# Altium project MainBoard_02_2023.PrjPcb
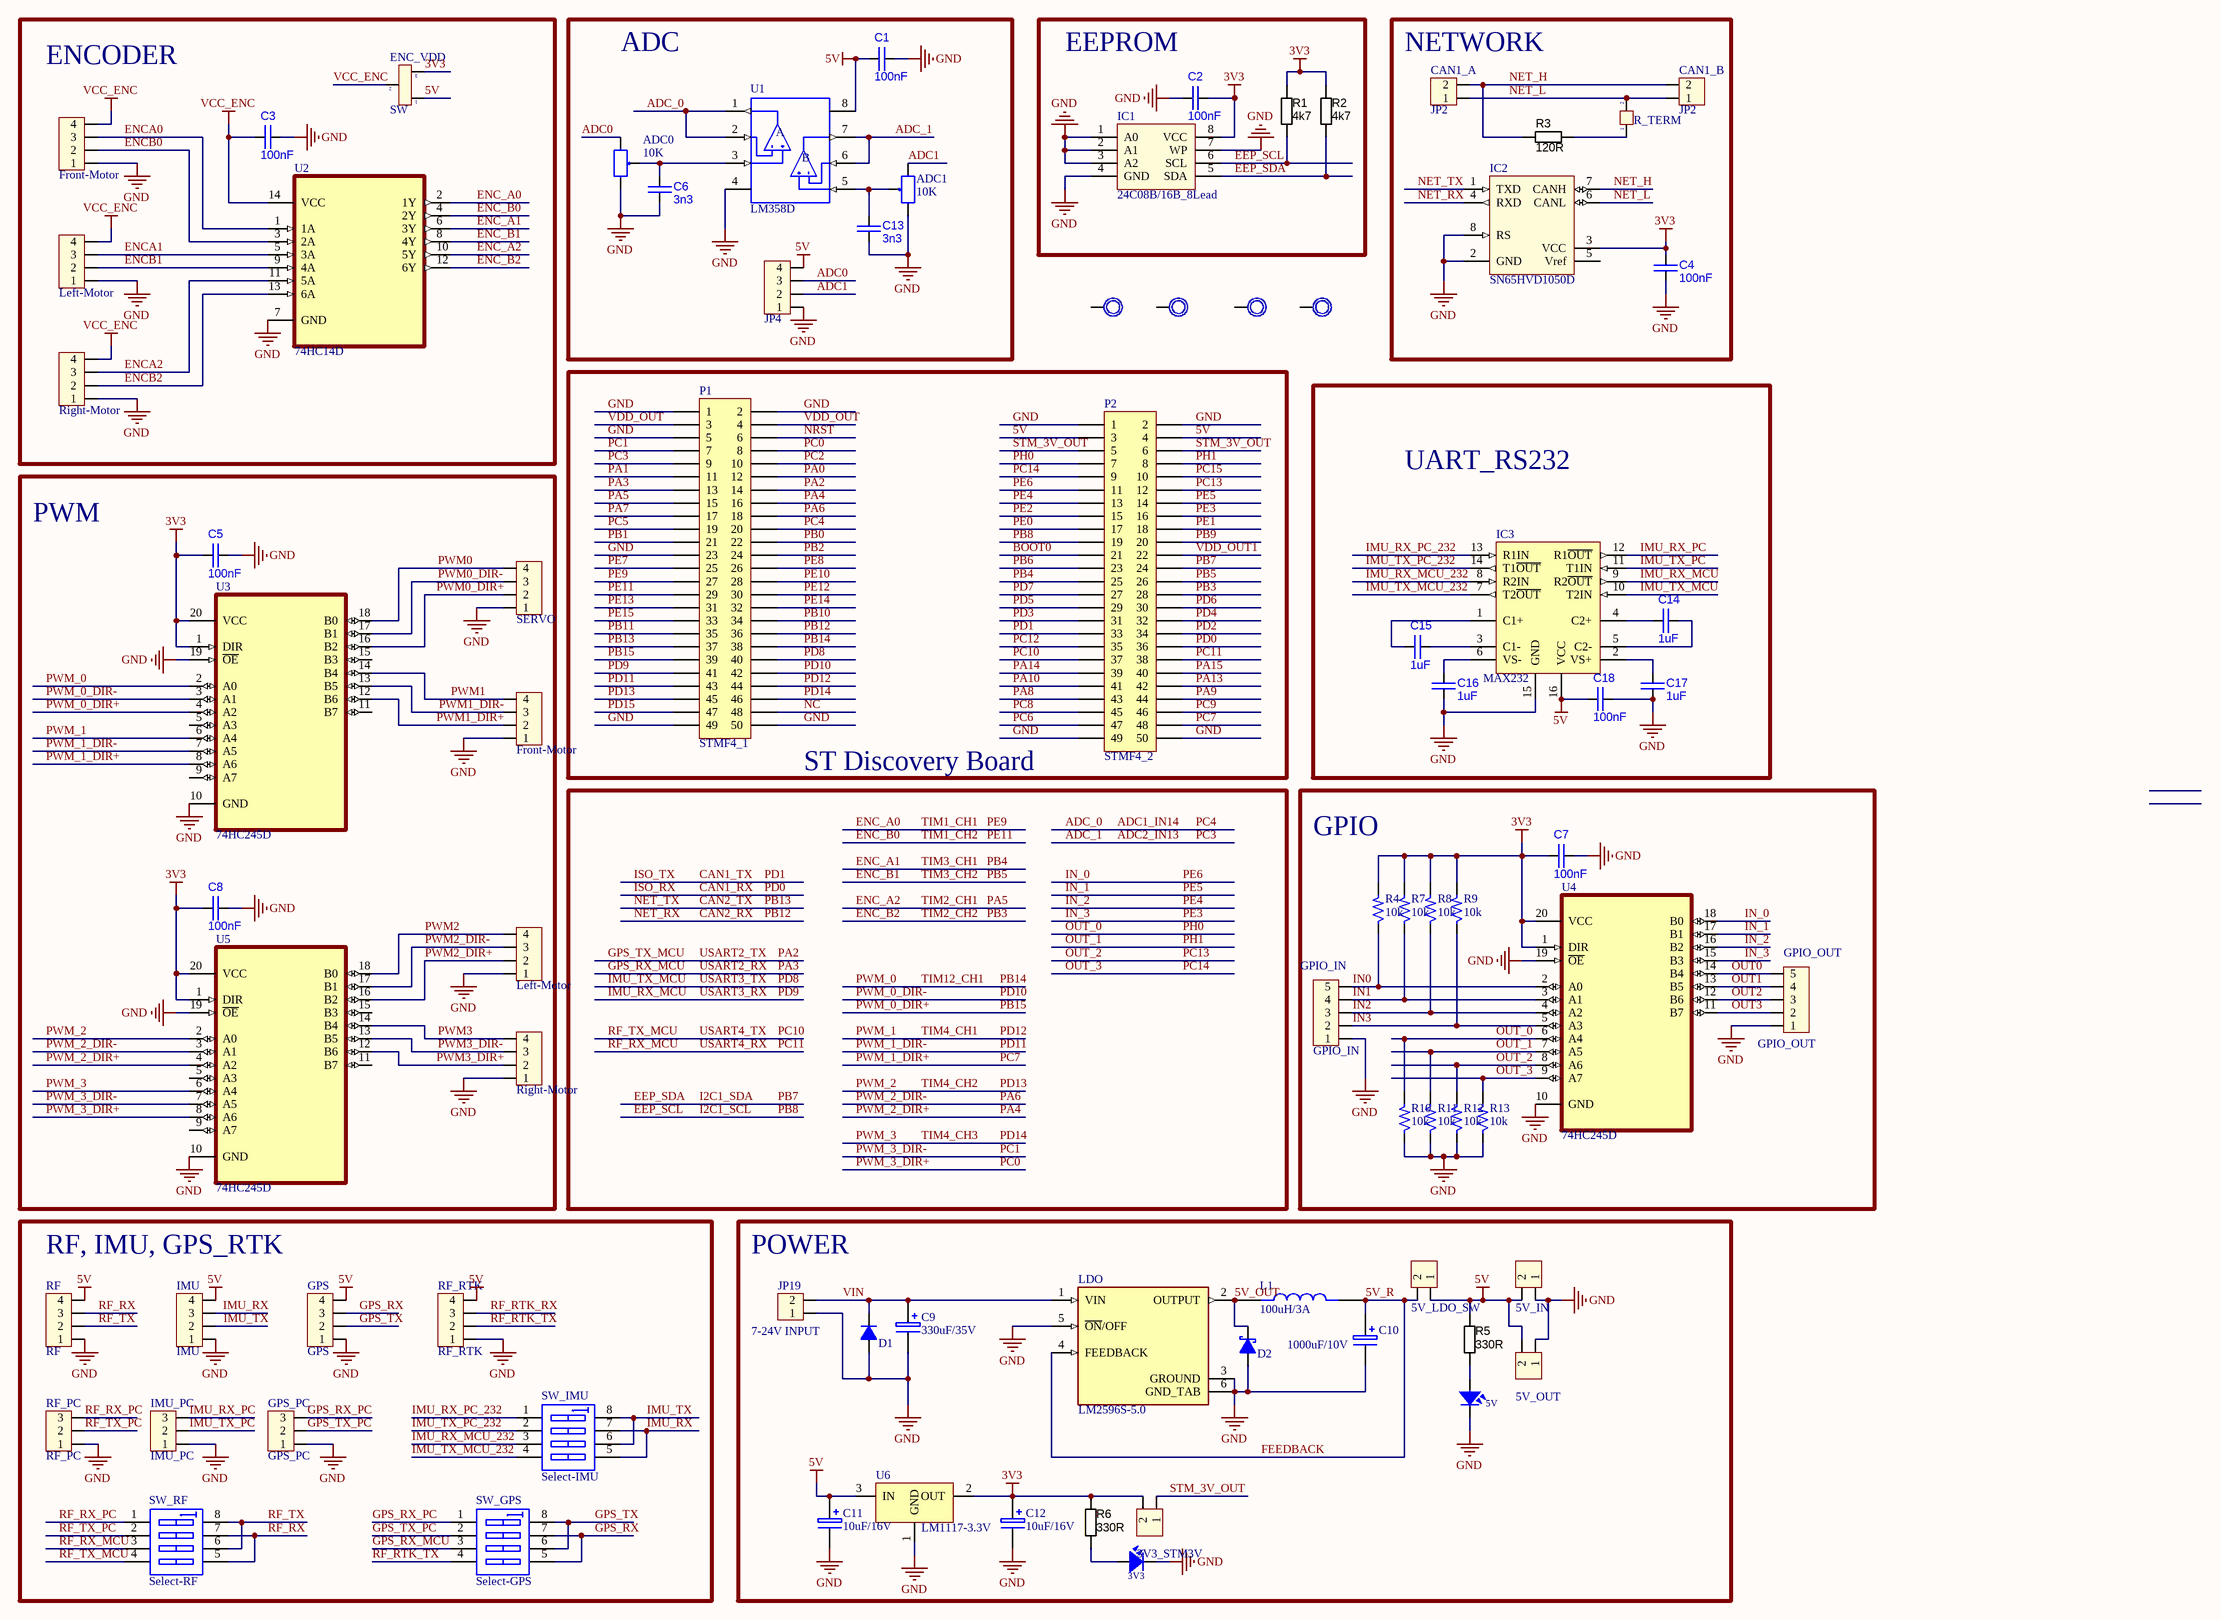
[diagram p0: Sheet1.SchDoc]
1 sheet, 83 parts. Net scope: global (net labels, ports and power ports of the same name join across sheets).
Board file: PCB2.PcbDoc

## Sheet Sheet1.SchDoc
size C

### Parts
3V3  LED SMD  [SM-LED-0805-Red]  (value not drawn)
3V3_STM3V  connector  [JP2]  (value not drawn)
5V  LED SMD  [SM-LED-0805-Red]  (value not drawn)
5V_IN  connector  [CON2]  (value not drawn)
5V_LDO_SW  connector  [JP2]  (value not drawn)
5V_OUT  connector  [CON2]  (value not drawn)
ADC  JP4  [CON4]
ADC0  10K  [VR1]
ADC1  10K  [VR1]
C1  value 100nF  [CAPC2012X135N]  (hidden comment: approved sub OK)
C2  value 100nF  [CAPC2012X135N]  (hidden comment: approved sub OK)
C3  value 100nF  [CAPC2012X135N]  (hidden comment: approved sub OK)
C4  value 100nF  [CAPC2012X135N]  (hidden comment: approved sub OK)
C5  value 100nF  [CAPC2012X135N]  (hidden comment: approved sub OK)
C6  value 3n3  [CAPC2012X135N]  (hidden comment: approved sub OK)
C7  value 100nF  [CAPC2012X135N]  (hidden comment: approved sub OK)
C8  value 100nF  [CAPC2012X135N]  (hidden comment: approved sub OK)
C9  330uF/35V  [cap_A_SMD 470uF/16V]
C10  1000uF/10V  [cap_A_SMD 470uF/16V]
C11  10uF/16V  [cap_A_SMD 10uF/16V]
C12  10uF/16V  [cap_A_SMD 10uF/16V]
C13  value 3n3  [CAPC2012X135N]  (hidden comment: approved sub OK)
C14  value 1uF  [CAPC2012X135N]  (hidden comment: approved sub OK)
C15  value 1uF  [CAPC2012X135N]  (hidden comment: approved sub OK)
C16  value 1uF  [CAPC2012X135N]  (hidden comment: approved sub OK)
C17  value 1uF  [CAPC2012X135N]  (hidden comment: approved sub OK)
C18  value 100nF  [CAPC2012X135N]  (hidden comment: approved sub OK)
CAN1_A  JP2  [CON2]
CAN1_B  JP2  [CON2]
D1  Diode  1N4007  [DO-214AC]  (value not drawn)
D2  Diode  Schottky 1N5819  [DO-214AC]  (value not drawn)
ENC_0  Front-Motor  [CON4]
ENC_1  Left-Motor  [CON4]
ENC_2  Right-Motor  [CON4]
ENC_VDD  SW  [JP3]
GPIO_IN  GPIO_IN  [CON5]
GPIO_OUT  GPIO_OUT  [CON5]
GPS  GPS  [CON4]
GPS_PC  GPS_PC  [CON3]
IC1  24C08B/16B_8Lead  [SOIC127P800X175-8N]
IC2  SN65HVD1050D  [SO-8N]
IC3  MAX232  [SO-G16]
IMU  IMU  [CON4]
IMU_PC  IMU_PC  [CON3]
JP19  7-24V INPUT  [MSTB 2/5.08mm]
L1  100uH/3A  [IND_B82477P4104M000]
LDO  LM2596S-5.0  [TO170P1524X483-6N]
P1  STMF4_1  [HDR2X25]
P2  STMF4_2  [HDR2X25]
PWM_1  Front-Motor  [CON4]
PWM_2  Left-Motor  [CON4]
PWM_3  Right-Motor  [CON4]
R1  value 4k7  [RESC2012N_ZERO]  (hidden comment: Jumper)
R2  value 4k7  [RESC2012N_ZERO]  (hidden comment: Jumper)
R3  value 120R  [RESC2012N_ZERO]  (hidden comment: Jumper)
R4  10k  [RESC2012N_ZERO]
R5  value 330R  [RESC2012N_ZERO]  (hidden comment: Jumper)
R6  value 330R  [RESC2012N_ZERO]  (hidden comment: Jumper)
R7  10k  [RESC2012N_ZERO]
R8  10k  [RESC2012N_ZERO]
R9  10k  [RESC2012N_ZERO]
R10  10k  [RESC2012N_ZERO]
R11  10k  [RESC2012N_ZERO]
R12  10k  [RESC2012N_ZERO]
R13  10k  [RESC2012N_ZERO]
R_TERM  Jumper 2  [JP2]  (value not drawn)
RF  RF  [CON4]
RF_PC  RF_PC  [CON3]
RF_RTK  RF_RTK  [CON4]
SERVO  SERVO  [CON4]
SW_GPS  Select-GPS  [DIP8/W0.3K]
SW_IMU  Select-IMU  [DIP8/W0.3K]
SW_RF  Select-RF  [DIP8/W0.3K]
TP1  TP  [TP6]  (value not drawn)
TP2  TP  [TP6]  (value not drawn)
TP3  TP  [TP6]  (value not drawn)
TP4  TP  [TP6]  (value not drawn)
U1  LM358D  [SOIC127P599X175-8N]
U2  74HC14D  [SOIC127P600X175-14N]
U3  74HC245D  [SOIC127P1032X265-20N]
U4  74HC245D  [SOIC127P1032X265-20N]
U5  74HC245D  [SOIC127P1032X265-20N]
U6  LM1117-3.3V  [LM1117-SOP]

### Blocks framed on the sheet
ENCODER: C3 ENC_0-ENC_2 ENC_VDD U2
ADC: ADC ADC0 ADC1 C1 C6 C13 U1
EEPROM: C2 IC1 R1 R2
NETWORK: C4 CAN1_A CAN1_B IC2 R3 R_TERM
ST Discovery Board: P1 P2
UART_RS232: C14-C18 IC3
PWM: C5 C8 PWM_1-PWM_3 SERVO U3 U5
GPIO: C7 GPIO_IN GPIO_OUT R4 R7-R13 U4
RF, IMU, GPS_RTK: GPS GPS_PC IMU IMU_PC RF RF_PC RF_RTK SW_GPS SW_IMU SW_RF
POWER: 3V3 3V3_STM3V 5V 5V_IN 5V_LDO_SW 5V_OUT C9-C12 D1 D2 JP19 L1 LDO R5 R6 U6

### Nets
3V3: 3V3_STM3V.2 C2.2 C4.2 C5.2 C7.2 C8.2 C12.1 ENC_VDD.3 IC1.8(VCC) IC2.3(VCC) R1.1 R2.1 R4.2 R6.1 R7.2 R8.2 R9.2 U3.1(DIR) U3.20(VCC) U4.1(DIR) U4.20(VCC) U5.1(DIR) U5.20(VCC) U6.2(OUT)
5V: 5V_IN.2 5V_LDO_SW.1 5V_OUT.2 ADC.4 C1.2 C11.1 C18.2 ENC_VDD.1 GPS.4 IC3.16(VCC) IMU.4 P2.3 P2.4 R5.1 RF.4 RF_RTK.4 U1.8(V+) U6.3(IN)
GND: 3V3.2 5V.2 5V_IN.1 5V_OUT.1 ADC.1 ADC0.1 ADC1.3 C1.1 C2.1 C3.1 C4.1 C5.1 C6.2 C7.1 C8.1 C9.2 C10.2 C11.2 C12.2 C13.2 C16.1 C17.1 C18.1 D1.A D2.A ENC_0.1 ENC_1.1 ENC_2.1 GPIO_IN.1 GPIO_OUT.1 GPS.1 GPS_PC.1 IC1.1(A0) IC1.2(A1) IC1.3(A2) IC1.4(GND) IC1.7(WP) IC2.2(GND) IC2.8(RS) IC3.15(GND) IMU.1 IMU_PC.1 JP19.1 LDO.3(GROUND) LDO.5(~{ON}/OFF) LDO.6(GND_TAB) P1.1 P1.2 P1.5 P1.23 P1.49 P1.50 P2.1 P2.2 P2.49 P2.50 PWM_1.1 PWM_2.1 PWM_3.1 R10.1 R11.1 R12.1 R13.1 RF.1 RF_PC.1 RF_RTK.1 SERVO.1 U1.4(V-) U2.7(GND) U3.10(GND) U3.19(~{OE}) U4.10(GND) U4.19(~{OE}) U5.10(GND) U5.19(~{OE}) U6.1(GND)
VCC_ENC: C3.2 ENC_0.4 ENC_1.4 ENC_2.4 ENC_VDD.2 U2.14(VCC)
5V_OUT: D2.K L1.1 LDO.2(OUTPUT)
5V_R: 5V_LDO_SW.2 C10.1 L1.2 LDO.4(FEEDBACK)  [also labelled FEEDBACK]
ADC0: ADC.3 ADC0.3
ADC1: ADC.2 ADC1.1
ADC1_IN14: P1.20 U1.1(OUT1) U1.2(IN1-)  [also labelled ADC_0, PC4]
ADC2_IN13: P1.9 U1.6(IN2-) U1.7(OUT2)  [also labelled ADC_1, PC3]
BOOT0: P2.21
CAN1_RX: P2.36  [also labelled ISO_RX, PD0]
CAN1_TX: P2.33  [also labelled ISO_TX, PD1]
CAN2_RX: IC2.4(RXD) P1.36  [also labelled NET_RX, PB12]
CAN2_TX: IC2.1(TXD) P1.37  [also labelled NET_TX, PB13]
EEP_SCL: IC1.6(SCL) P2.19 R1.2  [also labelled I2C1_SCL, PB8]
EEP_SDA: IC1.5(SDA) P2.24 R2.2  [also labelled I2C1_SDA, PB7]
ENC_A0: P1.27 U2.2(1Y)  [also labelled PE9, TIM1_CH1]
ENC_A1: P2.25 U2.6(3Y)  [also labelled PB4, TIM3_CH1]
ENC_A2: P1.15 U2.10(5Y)  [also labelled PA5, TIM2_CH1]
ENC_B0: P1.29 U2.4(2Y)  [also labelled PE11, TIM1_CH2]
ENC_B1: P2.26 U2.8(4Y)  [also labelled PB5, TIM3_CH2]
ENC_B2: P2.28 U2.12(6Y)  [also labelled PB3, TIM2_CH2]
ENCA0: ENC_0.3 U2.1(1A)
ENCA1: ENC_1.3 U2.5(3A)
ENCA2: ENC_2.3 U2.11(5A)
ENCB0: ENC_0.2 U2.3(2A)
ENCB1: ENC_1.2 U2.9(4A)
ENCB2: ENC_2.2 U2.13(6A)
GPS_RX: GPS.3 SW_GPS.5(B4) SW_GPS.7(B2)
GPS_RX_MCU: P1.13 SW_GPS.3(A3)  [also labelled PA3, USART2_RX]
GPS_RX_PC: GPS_PC.3 SW_GPS.1(A1)
GPS_TX: GPS.2 SW_GPS.6(B3) SW_GPS.8(B1)
GPS_TX_MCU: P1.14  [also labelled PA2, USART2_TX]
GPS_TX_PC: GPS_PC.2 SW_GPS.2(A2)
IMU_RX: IMU.3 SW_IMU.5(B4) SW_IMU.7(B2)
IMU_RX_MCU: IC3.9(R2~{OUT}) P1.41  [also labelled PD9, USART3_RX]
IMU_RX_MCU_232: IC3.8(R2IN) SW_IMU.3(A3)
IMU_RX_PC: IC3.12(R1~{OUT}) IMU_PC.3
IMU_RX_PC_232: IC3.13(R1IN) SW_IMU.1(A1)
IMU_TX: IMU.2 SW_IMU.6(B3) SW_IMU.8(B1)
IMU_TX_MCU: IC3.10(T2IN) P1.40  [also labelled PD8, USART3_TX]
IMU_TX_MCU_232: IC3.7(T2~{OUT}) SW_IMU.4(A4)
IMU_TX_PC: IC3.11(T1IN) IMU_PC.2
IMU_TX_PC_232: IC3.14(T1~{OUT}) SW_IMU.2(A2)
IN0: GPIO_IN.5 R4.1 U4.2(A0)
IN1: GPIO_IN.4 R7.1 U4.3(A1)
IN2: GPIO_IN.3 R8.1 U4.4(A2)
IN3: GPIO_IN.2 R9.1 U4.5(A3)
IN_0: P2.11 U4.18(B0)  [also labelled PE6]
IN_1: P2.14 U4.17(B1)  [also labelled PE5]
IN_2: P2.13 U4.16(B2)  [also labelled PE4]
IN_3: P2.16 U4.15(B3)  [also labelled PE3]
NC: P1.48
NET_H: CAN1_A.2 CAN1_B.2 IC2.7(CANH) R3.1
NET_L: CAN1_A.1 CAN1_B.1 IC2.6(CANL) R_TERM.2
NRST: P1.6
OUT0: GPIO_OUT.5 U4.14(B4)
OUT1: GPIO_OUT.4 U4.13(B5)
OUT2: GPIO_OUT.3 U4.12(B6)
OUT3: GPIO_OUT.2 U4.11(B7)
OUT_0: P2.7 R10.2 U4.6(A4)  [also labelled PH0]
OUT_1: P2.8 R11.2 U4.7(A5)  [also labelled PH1]
OUT_2: P2.12 R12.2 U4.8(A6)  [also labelled PC13]
OUT_3: P2.9 R13.2 U4.9(A7)  [also labelled PC14]
PA0: P1.12
PA1: P1.11
PA4: P1.16 U5.4(A2)  [also labelled PWM_2_DIR+]
PA6: P1.18 U5.3(A1)  [also labelled PWM_2_DIR-]
PA7: P1.17
PA8: P2.43
PA9: P2.44
PA10: P2.41
PA13: P2.42
PA14: P2.39
PA15: P2.40
PB0: P1.22
PB1: P1.21
PB2: P1.24
PB6: P2.23
PB9: P2.20
PB10: P1.34
PB11: P1.35
PB14: P1.38 U3.2(A0)  [also labelled PWM_0, TIM12_CH1]
PB15: P1.39 U3.4(A2)  [also labelled PWM_0_DIR+]
PC0: P1.8 U5.8(A6)  [also labelled PWM_3_DIR+]
PC1: P1.7 U5.7(A5)  [also labelled PWM_3_DIR-]
PC2: P1.10
PC5: P1.19
PC6: P2.47
PC7: P2.48 U3.8(A6)  [also labelled PWM_1_DIR+]
PC8: P2.45
PC9: P2.46
PC10: P2.37 SW_RF.4(A4)  [also labelled RF_TX_MCU, USART4_TX]
PC11: P2.38 SW_RF.3(A3)  [also labelled RF_RX_MCU, USART4_RX]
PC12: P2.35
PC15: P2.10
PD2: P2.34
PD3: P2.31
PD4: P2.32
PD5: P2.29
PD6: P2.30
PD7: P2.27
PD10: P1.42 U3.3(A1)  [also labelled PWM_0_DIR-]
PD11: P1.43 U3.7(A5)  [also labelled PWM_1_DIR-]
PD12: P1.44 U3.6(A4)  [also labelled PWM_1, TIM4_CH1]
PD13: P1.45 U5.2(A0)  [also labelled PWM_2, TIM4_CH2]
PD14: P1.46 U5.6(A4)  [also labelled PWM_3, TIM4_CH3]
PD15: P1.47
PE0: P2.17
PE1: P2.18
PE2: P2.15
PE7: P1.25
PE8: P1.26
PE10: P1.28
PE12: P1.30
PE13: P1.31
PE14: P1.32
PE15: P1.33
PWM0: SERVO.4 U3.18(B0)
PWM0_DIR+: SERVO.2 U3.16(B2)
PWM0_DIR-: SERVO.3 U3.17(B1)
PWM1: PWM_1.4 U3.14(B4)
PWM1_DIR+: PWM_1.2 U3.12(B6)
PWM1_DIR-: PWM_1.3 U3.13(B5)
PWM2: PWM_2.4 U5.18(B0)
PWM2_DIR+: PWM_2.2 U5.16(B2)
PWM2_DIR-: PWM_2.3 U5.17(B1)
PWM3: PWM_3.4 U5.14(B4)
PWM3_DIR+: PWM_3.2 U5.12(B6)
PWM3_DIR-: PWM_3.3 U5.13(B5)
RF_RTK_RX: RF_RTK.3
RF_RTK_TX: RF_RTK.2 SW_GPS.4(A4)
RF_RX: RF.3 SW_RF.5(B4) SW_RF.7(B2)
RF_RX_PC: RF_PC.3 SW_RF.1(A1)
RF_TX: RF.2 SW_RF.6(B3) SW_RF.8(B1)
RF_TX_PC: RF_PC.2 SW_RF.2(A2)
STM_3V_OUT: 3V3_STM3V.1 P2.5 P2.6
VDD_OUT: P1.3 P1.4
VDD_OUT1: P2.22
VIN: C9.1 D1.K JP19.2 LDO.1(VIN)
Net3V3_1: 3V3.1 R6.2
Net5V_1: 5V.1 R5.2
NetADC0_2: ADC0.2 C6.1 U1.3(IN1+)
NetADC1_2: ADC1.2 C13.1 U1.5(IN2+)
NetC14_1: C14.1 IC3.5(C2-)
NetC14_2: C14.2 IC3.4(C2+)
NetC15_1: C15.1 IC3.3(C1-)
NetC15_2: C15.2 IC3.1(C1+)
NetC16_2: C16.2 IC3.6(VS-)
NetC17_2: C17.2 IC3.2(VS+)
NetR3_2: R3.2 R_TERM.1

Not connected (* = marked no-connect by the designer): IC2 5(Vref); TP1 1; TP2 1; TP3 1; TP4 1; U3 5(A3) 9(A7) 11(B7) 15(B3); U5 5(A3) 9(A7) 11(B7) 15(B3)

### Notes on the sheet
- (in symbol LM358D) A; B

### Library data of the parts
3V3 5V = LED SMD 0805
3V3_STM3V 5V_IN 5V_LDO_SW 5V_OUT JP19 = Con2: connector 2
ADC ENC_0-ENC_2 GPS IMU PWM_1-PWM_3 RF RF_RTK SERVO = Con4: Connector 4; Value: Connector 4
ADC0 ADC1 = VR: Var Resistor; Value: VR 10K
C1-C8 C13-C18 = CAP C_0805: Capacitor SMD Cer 1.8nF 10% 50V X7R 0805; Manufacturer 1: AVX Corporation; Manufacturer Part Number 1: 08055C182KAT2A; Ratings: 50V; X7R; SCDType: source*; Tolerance: ±10%; Operating Temperature: -55°C ~ 125°C; Package / Case: 0805 (2012 metric); Supplier 1: Digi-Key; Supplier Part Number 1: 478-1374-1-ND
C9-C12 = CAP hoa: Cap
CAN1_A CAN1_B = Con2: Connector 2; Value: Connector 2
D1 = Diode  1N4007: Diode 1A; Value: 1N4007
D2 = Diode  Schottky 1N5819: Diode 1A; Value: 1N4007
ENC_VDD = JP 2-1: Jumper 2-1; Value: J2-1
GPIO_IN GPIO_OUT = Con5: Connector 5; Value: Connector 5
GPS_PC IMU_PC RF_PC = Con3: Connector 3; Value: Connector 3
IC1 = 24C08B/16B_8Lead: Standard 2-Wire Bus Interface Serial EEPROM; Value: 24Cxx; Value: DIP 8; Copyright by: VanDungEvn
IC2 = SN65HVD1050D: CAN DRIVER
IC3 = MAX232: Dual EIA-232 Driver/Receiver; Value: MAX232
L1 = B82477P4104M000: MF: TDK ELECTRONICS; Value: *; MP: B82477P4104M000; Purchase-URL: https://pricing.snapeda.com/search/part/B82477P4104M000/?ref=eda; Package: None; Check_prices: https://www.snapeda.com/parts/B82477P4104M000/TM+Electronics/view-part/?ref=eda; Price: None; Availability: In Stock; SnapEDA_Link: https://www.snapeda.com/parts/B82477P4104M000/TM+Electronics/view-part/?ref=snap
LDO = LM2596S-5.0: SIMPLE SWITCHER&reg; 4.5V to 40V, 3A Low Component Count Step-Down Regulator; MP: LM2596S-5.0/NOPB; MF: Texas Instruments; Price: None; Availability: In Stock; Package: TO-263-5 Texas Instruments; SnapEDA_Link: https://www.snapeda.com/parts/LM2596S-5.0/NOPB/Texas+Instruments/view-part/?ref=snap; Check_prices: https://www.snapeda.com/parts/LM2596S-5.0/NOPB/Texas+Instruments/view-part/?ref=eda; Value: *; Purchase-URL: https://pricing.snapeda.com/search/part/LM2596S-5.0/NOPB/?ref=eda
P1 P2 = Header 25X2: Header, 25-Pin, Dual row; LatestRevisionDate: 17-Jul-2002; LatestRevisionNote: Re-released for DXP Platform.; Publisher: Altium Limited
R1-R3 R5 R6 = RES_0805: Resistor SMD chip 0.0 Ohm 0.125W 0805; Manufacturer 1: Samsung Electro-Mechanics America, Inc; Manufacturer Part Number 1: RC2012J000CS; Ratings: 1/8W; SCDType: spec; Tolerance: N/A; Package / Case: 0805 (2012 metric); Supplier 1: Digi-Key; Supplier Part Number 1: 1276-5466-6-ND; RoHS 1: RoHS Compliant; ComponentLink1URL: http://www.samsungsem.com/servlet/FileDownload?filename=productcatalog/pdf/Chip_Resistor.pdf; ComponentLink1Description: http://www.samsungsem.com/servlet/FileDownload?filename=productcatalog/pdf/Chip_Resistor.pdf; Supplier 2: Digi-Key; Supplier Part Number 2: RMCF0805ZT0R00DKR-ND; Manufacturer 2: Stackpole Electronics Inc; Manufacturer Part Number 2: RMCF0805ZT0R00; RoHS 2: RoHS Compliant; ComponentLink2URL: http://www.seielect.com/Catalog/SEI-RMCF_RMCP.pdf; ComponentLink2Description: http://www.seielect.com/Catalog/SEI-RMCF_RMCP.pdf; Supplier 3: Digi-Key; Supplier Part Number 3: 311-0.0ARDKR-ND; Manufacturer 3: Yageo; Manufacturer Part Number 3: RC0805JR-070RL; RoHS 3: RoHS Compliant; ComponentLink3URL: http://media.digikey.com/pdf/Data%20Sheets/Yageo%20PDFs/RC0805%20Pb%20Free.pdf; ComponentLink3Description: http://media.digikey.com/pdf/Data%20Sheets/Yageo%20PDFs/RC0805%20Pb%20Free.pdf; Supplier 4: Digi-Key; Supplier Part Number 4: P0.0ADKR-ND; Manufacturer 4: Panasonic Electronic Components; Manufacturer Part Number 4: ERJ-6GEY0R00V; RoHS 4: RoHS Compliant; ComponentLink4URL: http://industrial.panasonic.com/www-cgi/jvcr13pz.cgi?E+PZ+3+AOA0001+ERJ6GEY0R00V+7+WW; ComponentLink4Description: http://industrial.panasonic.com/www-cgi/jvcr13pz.cgi?E+PZ+3+AOA0001+ERJ6GEY0R00V+7+WW; Supplier 5: Digi-Key; Supplier Part Number 5: RHM0.0CPDKR-ND; Manufacturer 5: Rohm Semiconductor; Manufacturer Part Number 5: MCR10ERTJ000; RoHS 5: RoHS Compliant; ComponentLink5URL: http://rohmfs.rohm.com/en/products/databook/datasheet/passive/resistor/chip_resistor/mcr_g.pdf; ComponentLink5Description: http://rohmfs.rohm.com/en/products/databook/datasheet/passive/resistor/chip_resistor/mcr_g.pdf
R4 R7-R13 = Res
R_TERM = JP 2: Value: JP 2
SW_GPS SW_IMU SW_RF = SWDIP-4: DIP Switch, 4 Position, SPST; Value: SW - DIP4
TP1-TP4 = TP1: Test Point; Value: Test Point
U1 = LM358D: Dual standard operational amplifier 8-SOIC 0 to 70; MF: Texas Instruments; Digi-Key_Part_Number: 296-1014-2-ND; Arrow_Electronics-Purchase-URL: https://snapeda.com/shop?store=Arrow+Electronics&id=4793021; MP: LM358D; Value: *; SnapEDA_Link: https://www.snapeda.com/parts/LM358D/Texas%20Instruments/view-part/4793021/?ref=snap; DigiKey-Purchase-URL: https://snapeda.com/shop?store=DigiKey&id=4793021; Package: SOIC-8 Texas Instruments; Texas_Instruments-Purchase-URL: https://snapeda.com/shop?store=Texas+Instruments&id=4793021; Mouser-Purchase-URL: https://snapeda.com/shop?store=Mouser&id=4793021; Arrow_Asia-Purchase-URL: https://snapeda.com/shop?store=Arrow+Asia&id=4793021; Check_prices: https://www.snapeda.com/parts/LM358D/Texas%20Instruments/view-part/4793021/?ref=eda
U2 = 74HC14D: Inverter IC 6 Channel Schmitt Trigger 14-SOIC; MF: Toshiba; SnapEDA_Link: https://www.snapeda.com/parts/74HC14D/Toshiba+Semiconductor+and+Storage/view-part/?ref=snap; Availability: In Stock; Price: None; Package: SO14-14 Nexperia USA Inc.; Purchase-URL: https://pricing.snapeda.com/search/part/74HC14D/?ref=eda; Check_prices: https://www.snapeda.com/parts/74HC14D/Toshiba+Semiconductor+and+Storage/view-part/?ref=eda; Value: *; MP: 74HC14D
U3-U5 = 74HC245D: Transceiver, Non-Inverting 1 Element 8 Bit per Element 3-State Output 20-SOIC; MF: Toshiba; SnapEDA_Link: https://www.snapeda.com/parts/74HC245D/Toshiba+Semiconductor+and+Storage/view-part/?ref=snap; Package: SOIC-20 Toshiba Semiconductor; MP: 74HC245D; Check_prices: https://www.snapeda.com/parts/74HC245D/Toshiba+Semiconductor+and+Storage/view-part/?ref=eda; Purchase-URL: https://pricing.snapeda.com/search/part/74HC245D/?ref=eda; Price: None; Value: *; Availability: In Stock
U6 = LM1117: 800mA Low-Dropout Linear Regulator; Creator: Nguyen Ba Bien; Website: http://group3i.net